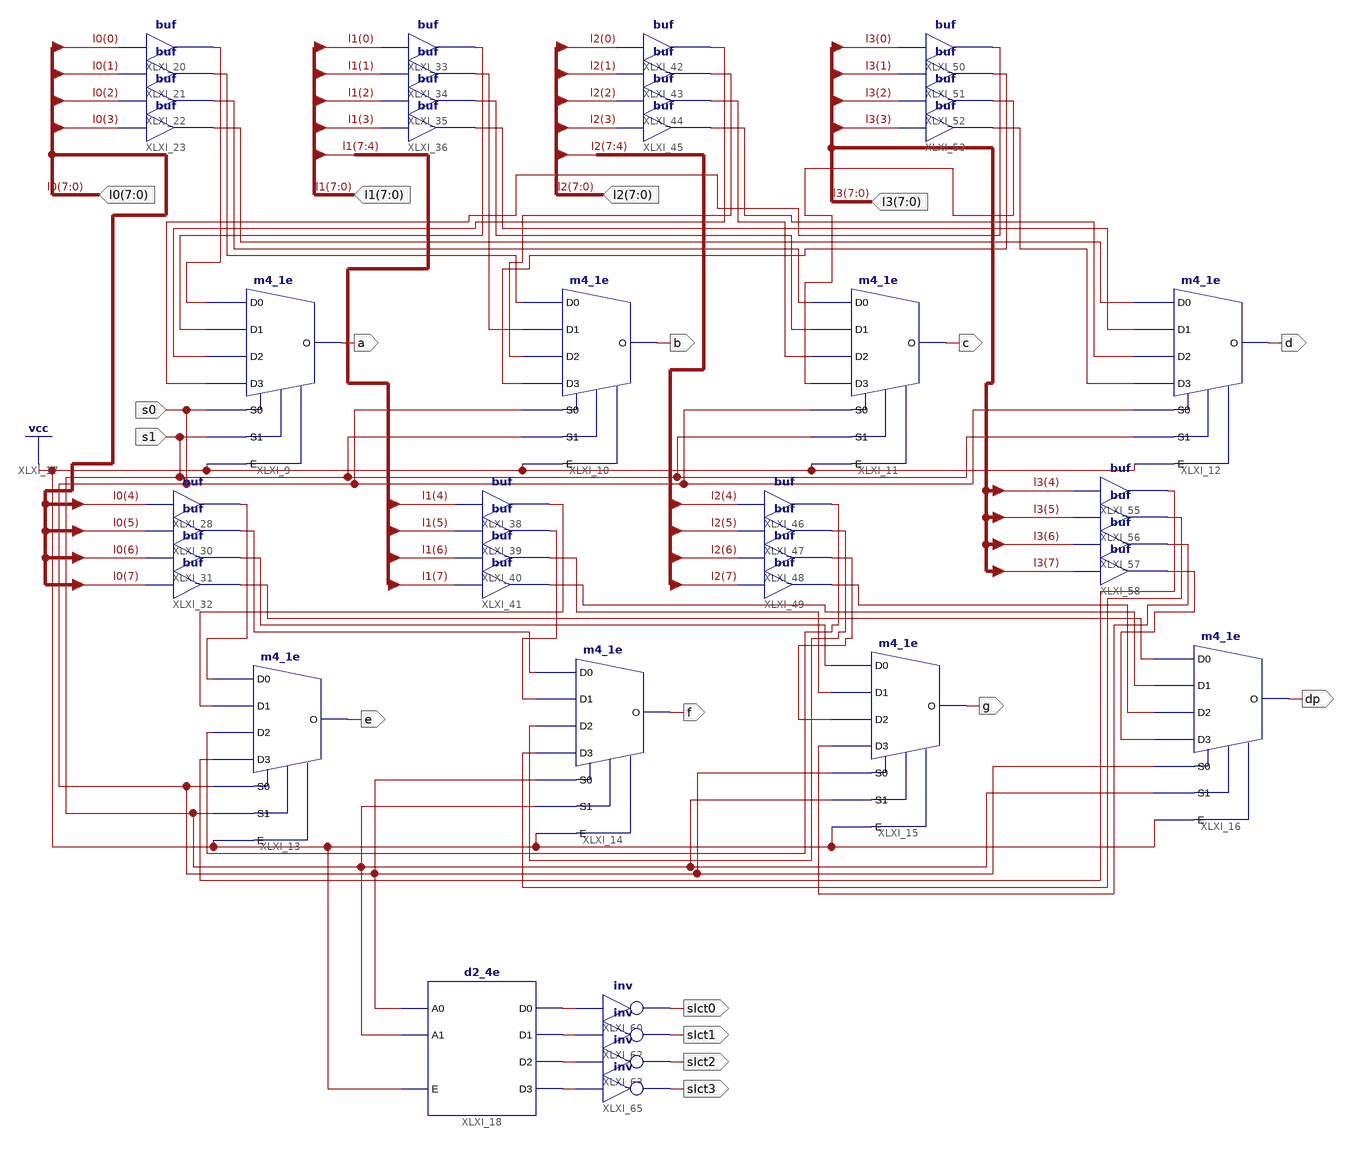
[diagram p0: schematic sheet 1]
// Xilinx ISE schematic displayer.sch (spartan3e) as structural Verilog: 45 symbols, 18 ports
module displayer (
  input  s0,
  input  s1,
  input  [7:0] l0,
  input  [7:0] l1,
  input  [7:0] l2,
  input  [7:0] l3,
  output a,
  output e,
  output b,
  output f,
  output c,
  output g,
  output dp,
  output d,
  output slct0,
  output slct1,
  output slct2,
  output slct3
);

  wire XLXN_94, XLXN_100, XLXN_102, XLXN_104, XLXN_111, XLXN_112, XLXN_114, XLXN_116, XLXN_123, XLXN_124,
       XLXN_125, XLXN_126, XLXN_133, XLXN_134, XLXN_135, XLXN_137, XLXN_144, XLXN_146, XLXN_147, XLXN_148,
       XLXN_153, XLXN_154, XLXN_156, XLXN_157, XLXN_165, XLXN_166, XLXN_170, XLXN_171, XLXN_176, XLXN_177,
       XLXN_178, XLXN_179, XLXN_184, XLXN_185, XLXN_186, XLXN_187;

  m4_1e XLXI_9 (.D0(XLXN_94), .D1(XLXN_123), .D2(XLXN_144), .D3(XLXN_165), .E(1'b1), .S0(s0), .S1(s1), .O(a));
  m4_1e XLXI_10 (.D0(XLXN_100), .D1(XLXN_124), .D2(XLXN_146), .D3(XLXN_166), .E(1'b1), .S0(s0), .S1(s1), .O(b));
  m4_1e XLXI_11 (.D0(XLXN_102), .D1(XLXN_125), .D2(XLXN_147), .D3(XLXN_170), .E(1'b1), .S0(s0), .S1(s1), .O(c));
  m4_1e XLXI_12 (.D0(XLXN_104), .D1(XLXN_126), .D2(XLXN_148), .D3(XLXN_171), .E(1'b1), .S0(s0), .S1(s1), .O(d));
  m4_1e XLXI_13 (.D0(XLXN_111), .D1(XLXN_133), .D2(XLXN_153), .D3(XLXN_176), .E(1'b1), .S0(s0), .S1(s1), .O(e));
  m4_1e XLXI_14 (.D0(XLXN_112), .D1(XLXN_134), .D2(XLXN_154), .D3(XLXN_177), .E(1'b1), .S0(s0), .S1(s1), .O(f));
  m4_1e XLXI_15 (.D0(XLXN_114), .D1(XLXN_135), .D2(XLXN_156), .D3(XLXN_178), .E(1'b1), .S0(s0), .S1(s1), .O(g));
  m4_1e XLXI_16 (.D0(XLXN_116), .D1(XLXN_137), .D2(XLXN_157), .D3(XLXN_179), .E(1'b1), .S0(s0), .S1(s1), .O(dp));
  d2_4e XLXI_18 (.A0(s0), .A1(s1), .E(1'b1), .D0(XLXN_184), .D1(XLXN_185), .D2(XLXN_186), .D3(XLXN_187));
  buf XLXI_20 (XLXN_94, l0[0]);
  buf XLXI_21 (XLXN_100, l0[1]);
  buf XLXI_22 (XLXN_102, l0[2]);
  buf XLXI_23 (XLXN_104, l0[3]);
  buf XLXI_28 (XLXN_111, l0[4]);
  buf XLXI_30 (XLXN_112, l0[5]);
  buf XLXI_31 (XLXN_114, l0[6]);
  buf XLXI_32 (XLXN_116, l0[7]);
  buf XLXI_33 (XLXN_123, l1[0]);
  buf XLXI_34 (XLXN_124, l1[1]);
  buf XLXI_35 (XLXN_125, l1[2]);
  buf XLXI_36 (XLXN_126, l1[3]);
  buf XLXI_38 (XLXN_133, l1[4]);
  buf XLXI_39 (XLXN_134, l1[5]);
  buf XLXI_40 (XLXN_135, l1[6]);
  buf XLXI_41 (XLXN_137, l1[7]);
  buf XLXI_42 (XLXN_144, l2[0]);
  buf XLXI_43 (XLXN_146, l2[1]);
  buf XLXI_44 (XLXN_147, l2[2]);
  buf XLXI_45 (XLXN_148, l2[3]);
  buf XLXI_46 (XLXN_153, l2[4]);
  buf XLXI_47 (XLXN_154, l2[5]);
  buf XLXI_48 (XLXN_156, l2[6]);
  buf XLXI_49 (XLXN_157, l2[7]);
  buf XLXI_50 (XLXN_165, l3[0]);
  buf XLXI_51 (XLXN_166, l3[1]);
  buf XLXI_52 (XLXN_170, l3[2]);
  buf XLXI_53 (XLXN_171, l3[3]);
  buf XLXI_55 (XLXN_176, l3[4]);
  buf XLXI_56 (XLXN_177, l3[5]);
  buf XLXI_57 (XLXN_178, l3[6]);
  buf XLXI_58 (XLXN_179, l3[7]);
  not XLXI_60 (slct0, XLXN_184);
  not XLXI_62 (slct1, XLXN_185);
  not XLXI_63 (slct2, XLXN_186);
  not XLXI_65 (slct3, XLXN_187);
endmodule
